# Altium schematic sheet PCB-PWR.SchDoc
size 420 x 297 mm
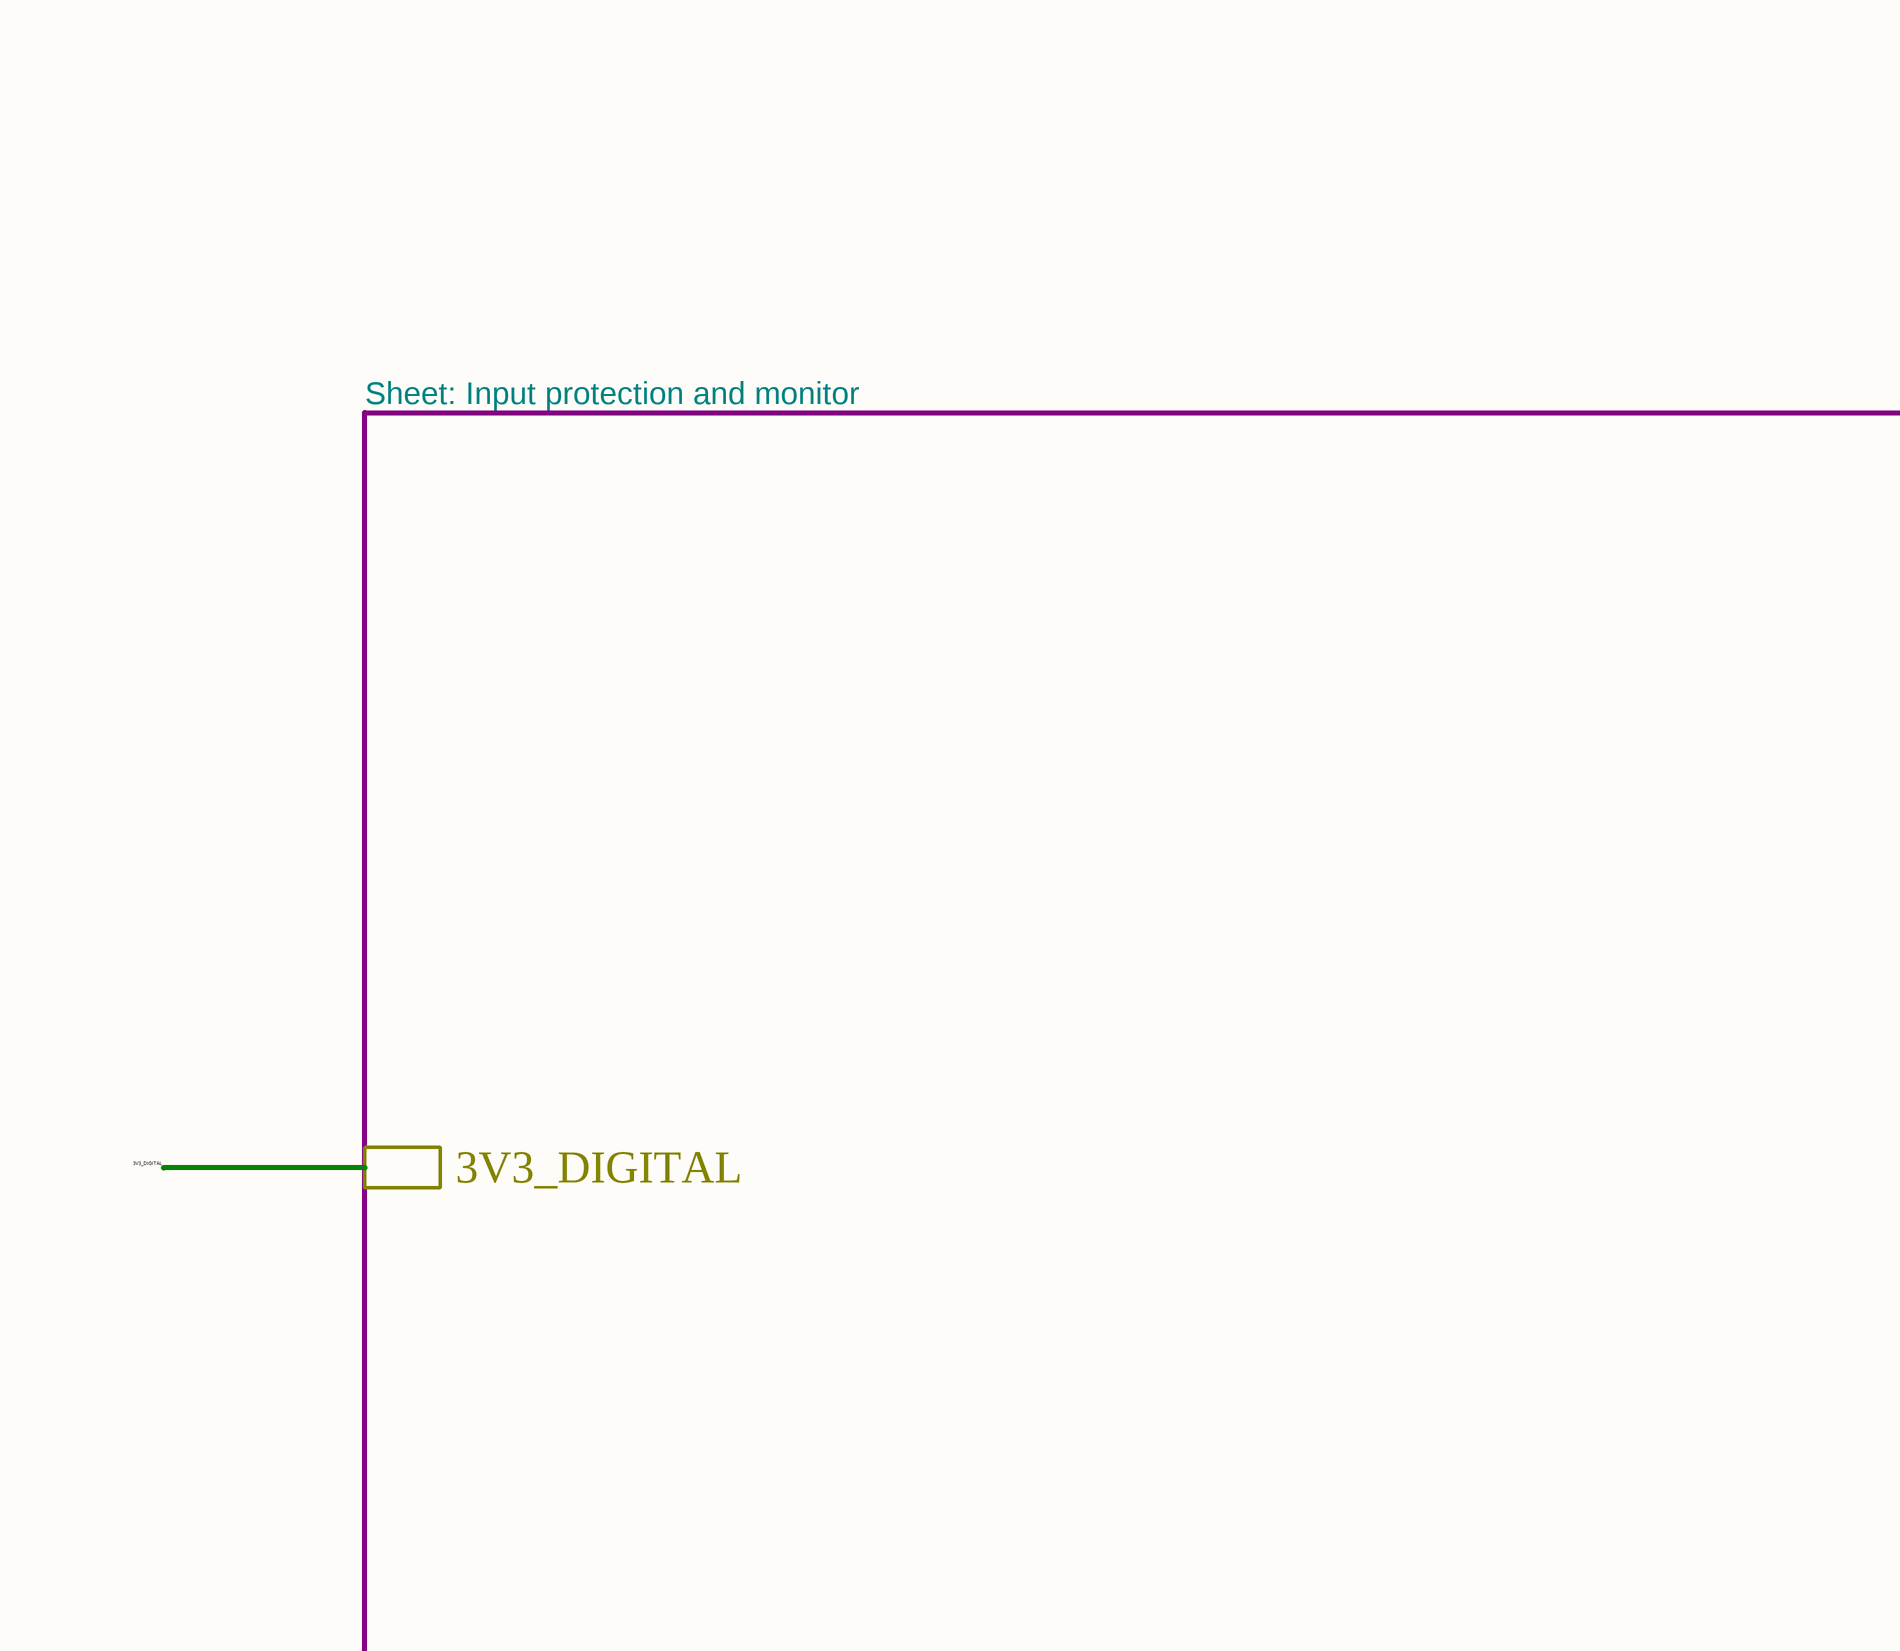
[diagram p0: PCB-PWR.SchDoc, top column 1 of 4]
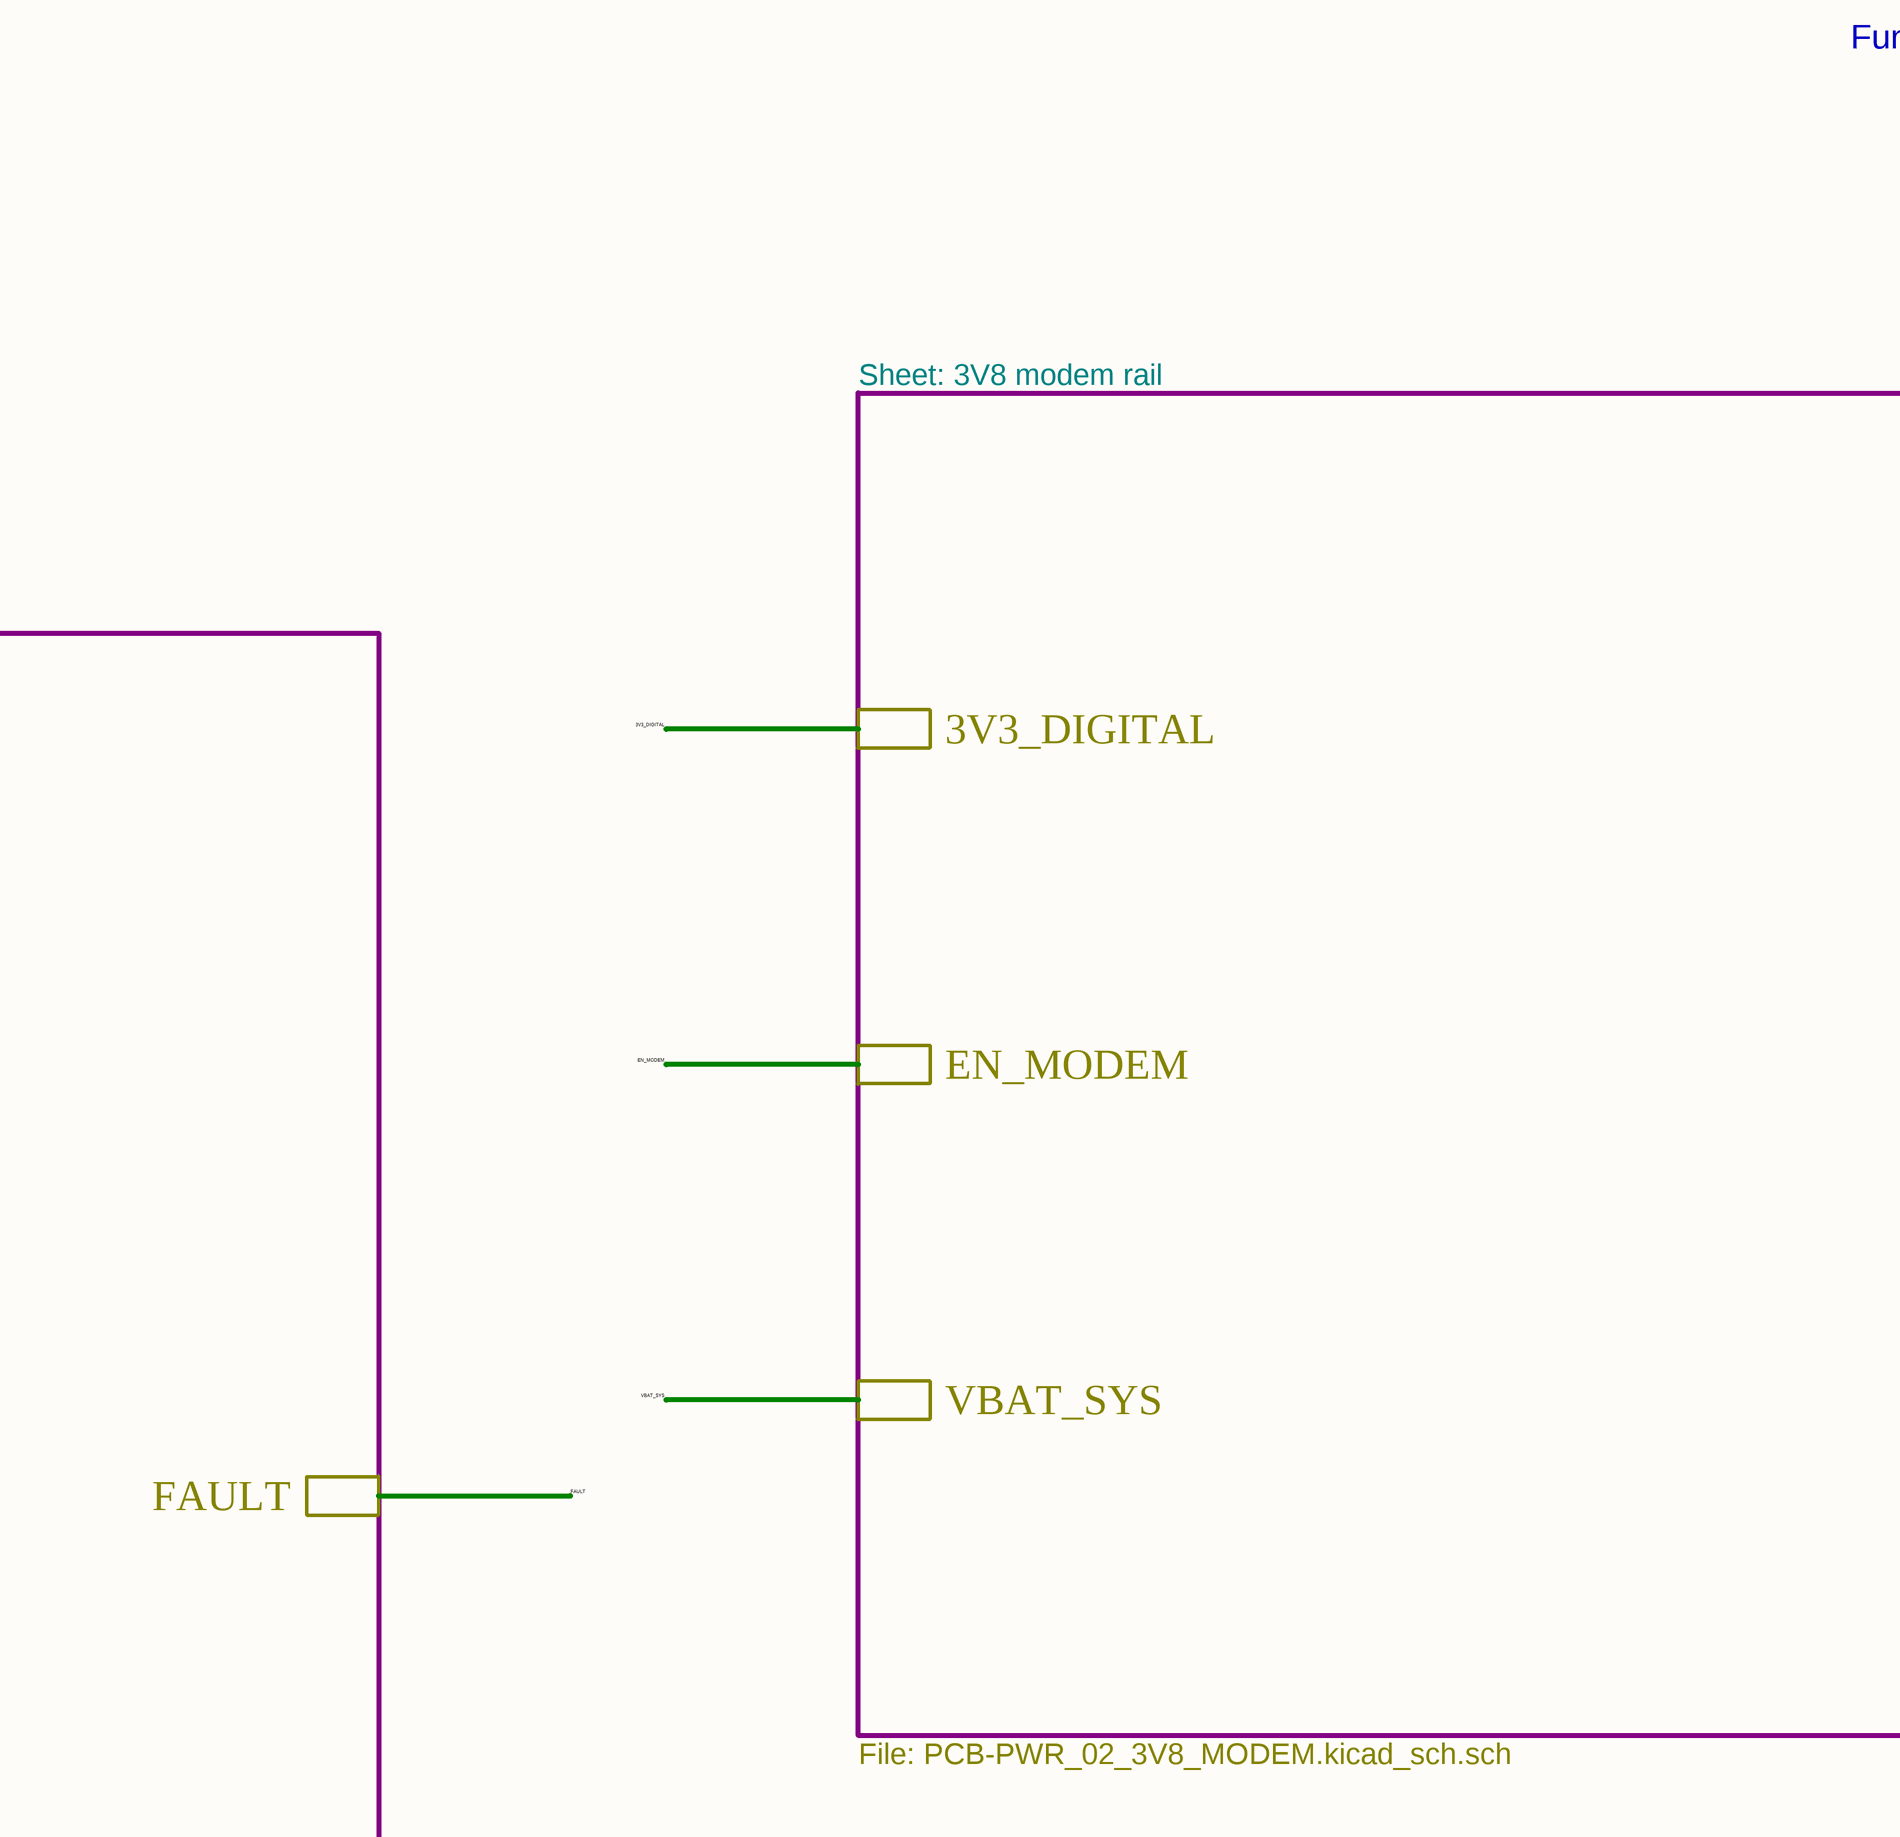
[diagram p1: PCB-PWR.SchDoc, top column 2 of 4]
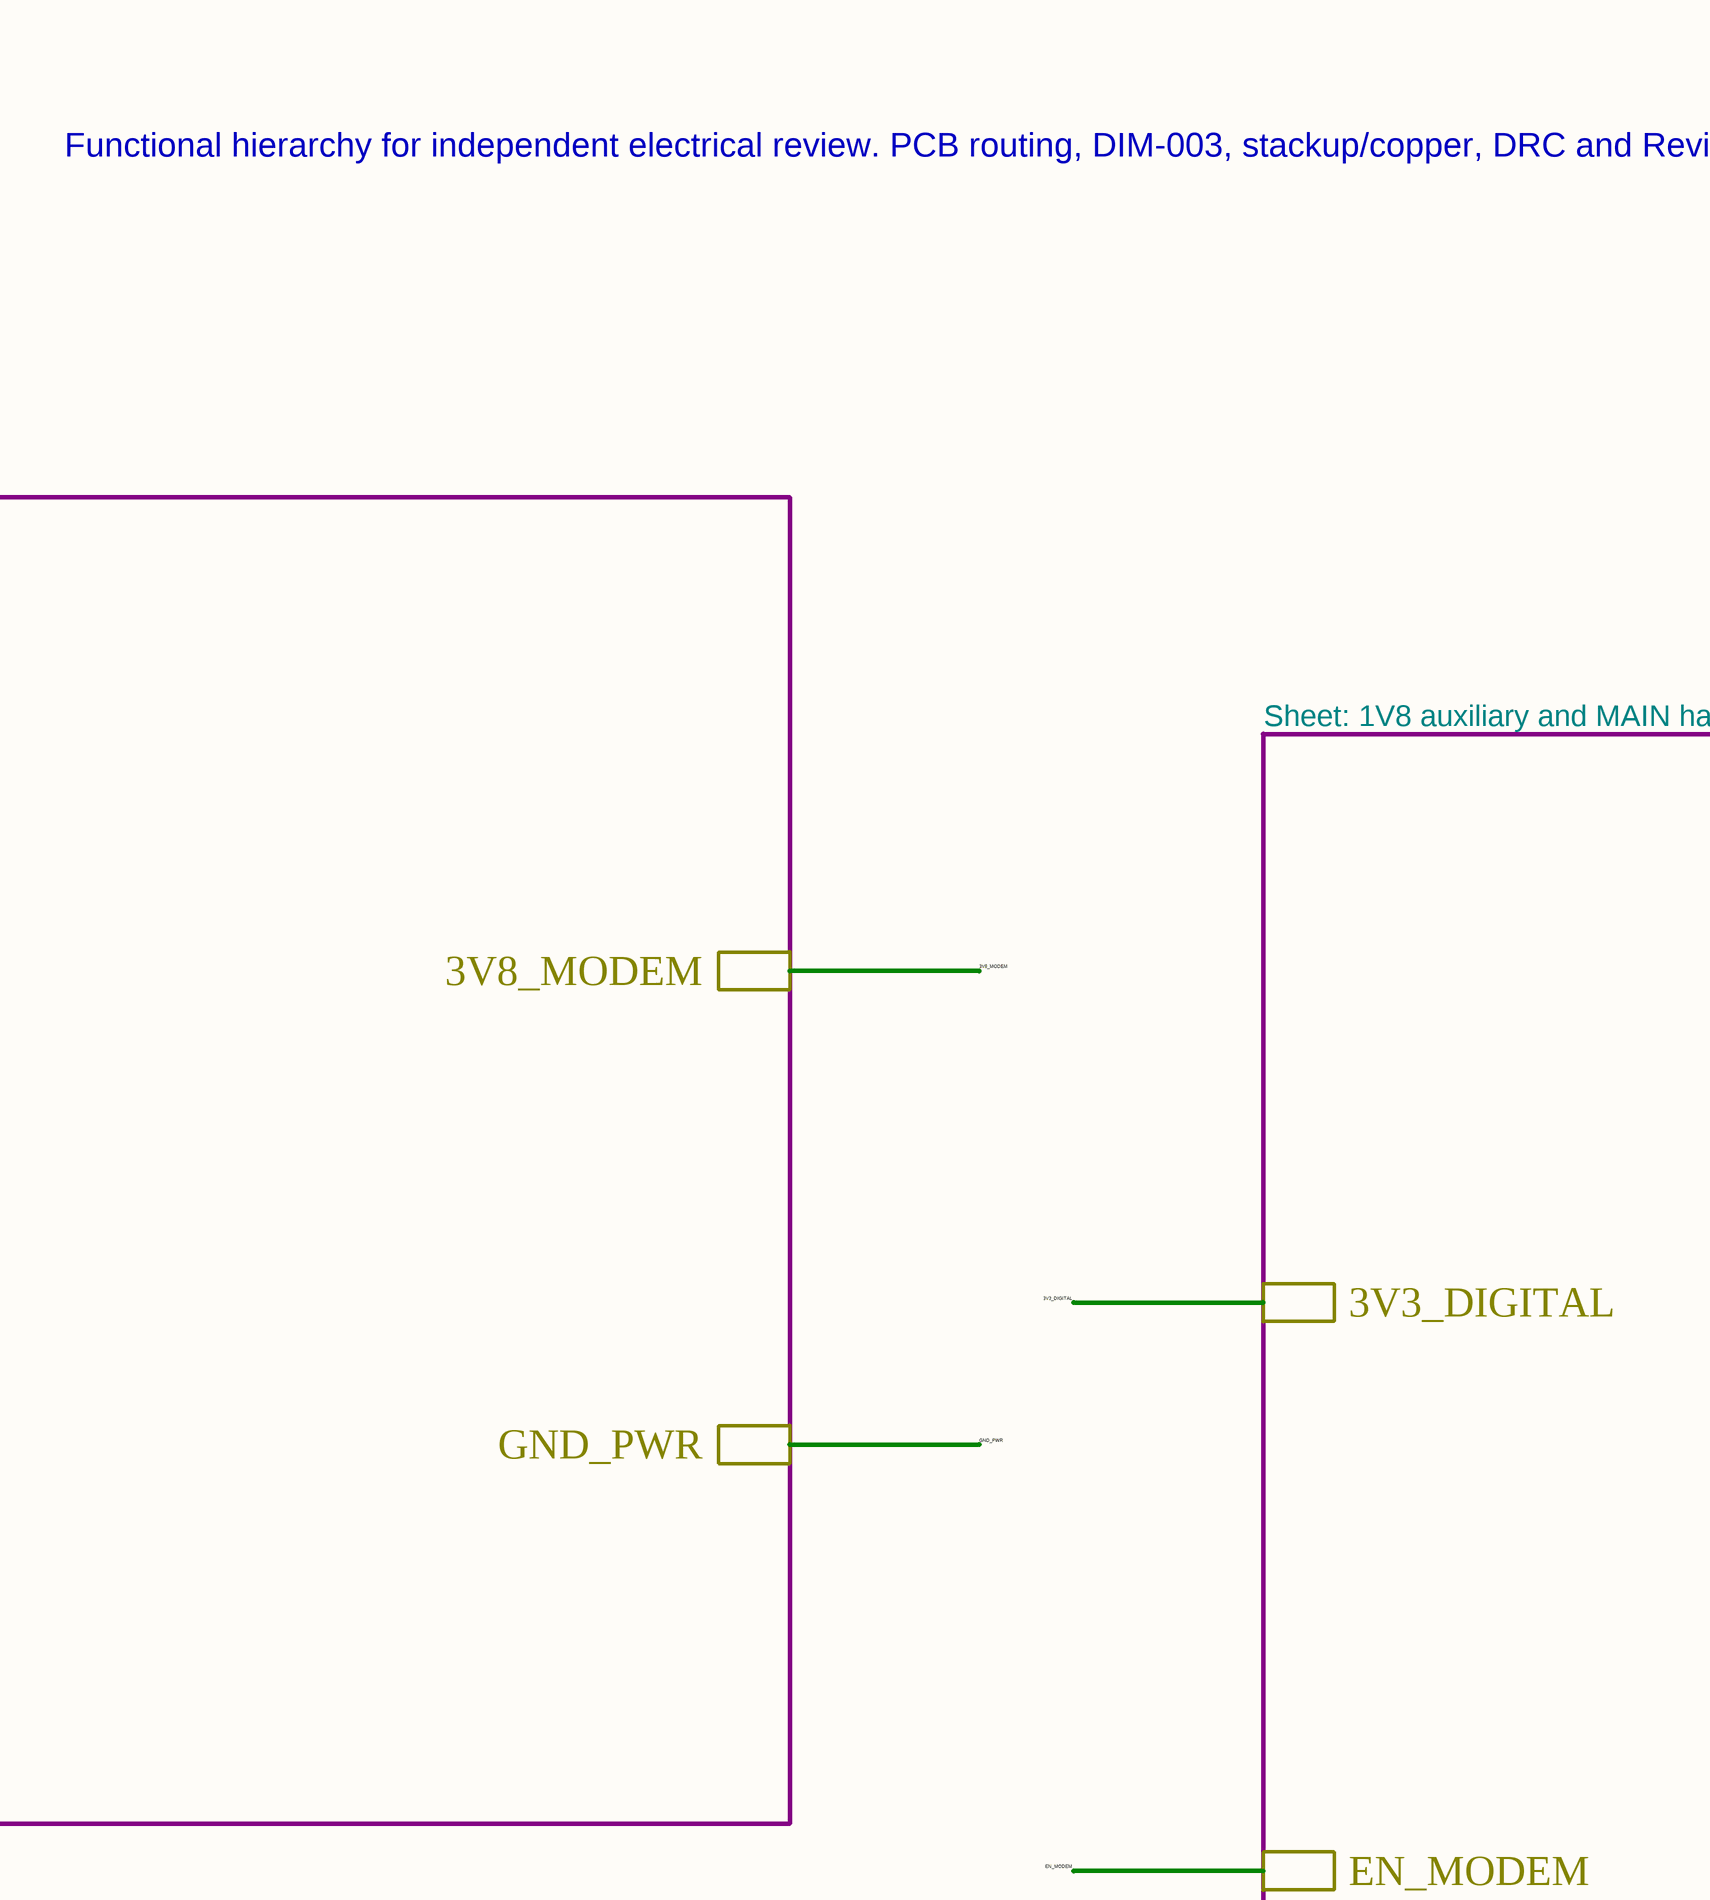
[diagram p2: PCB-PWR.SchDoc, top column 3 of 4]
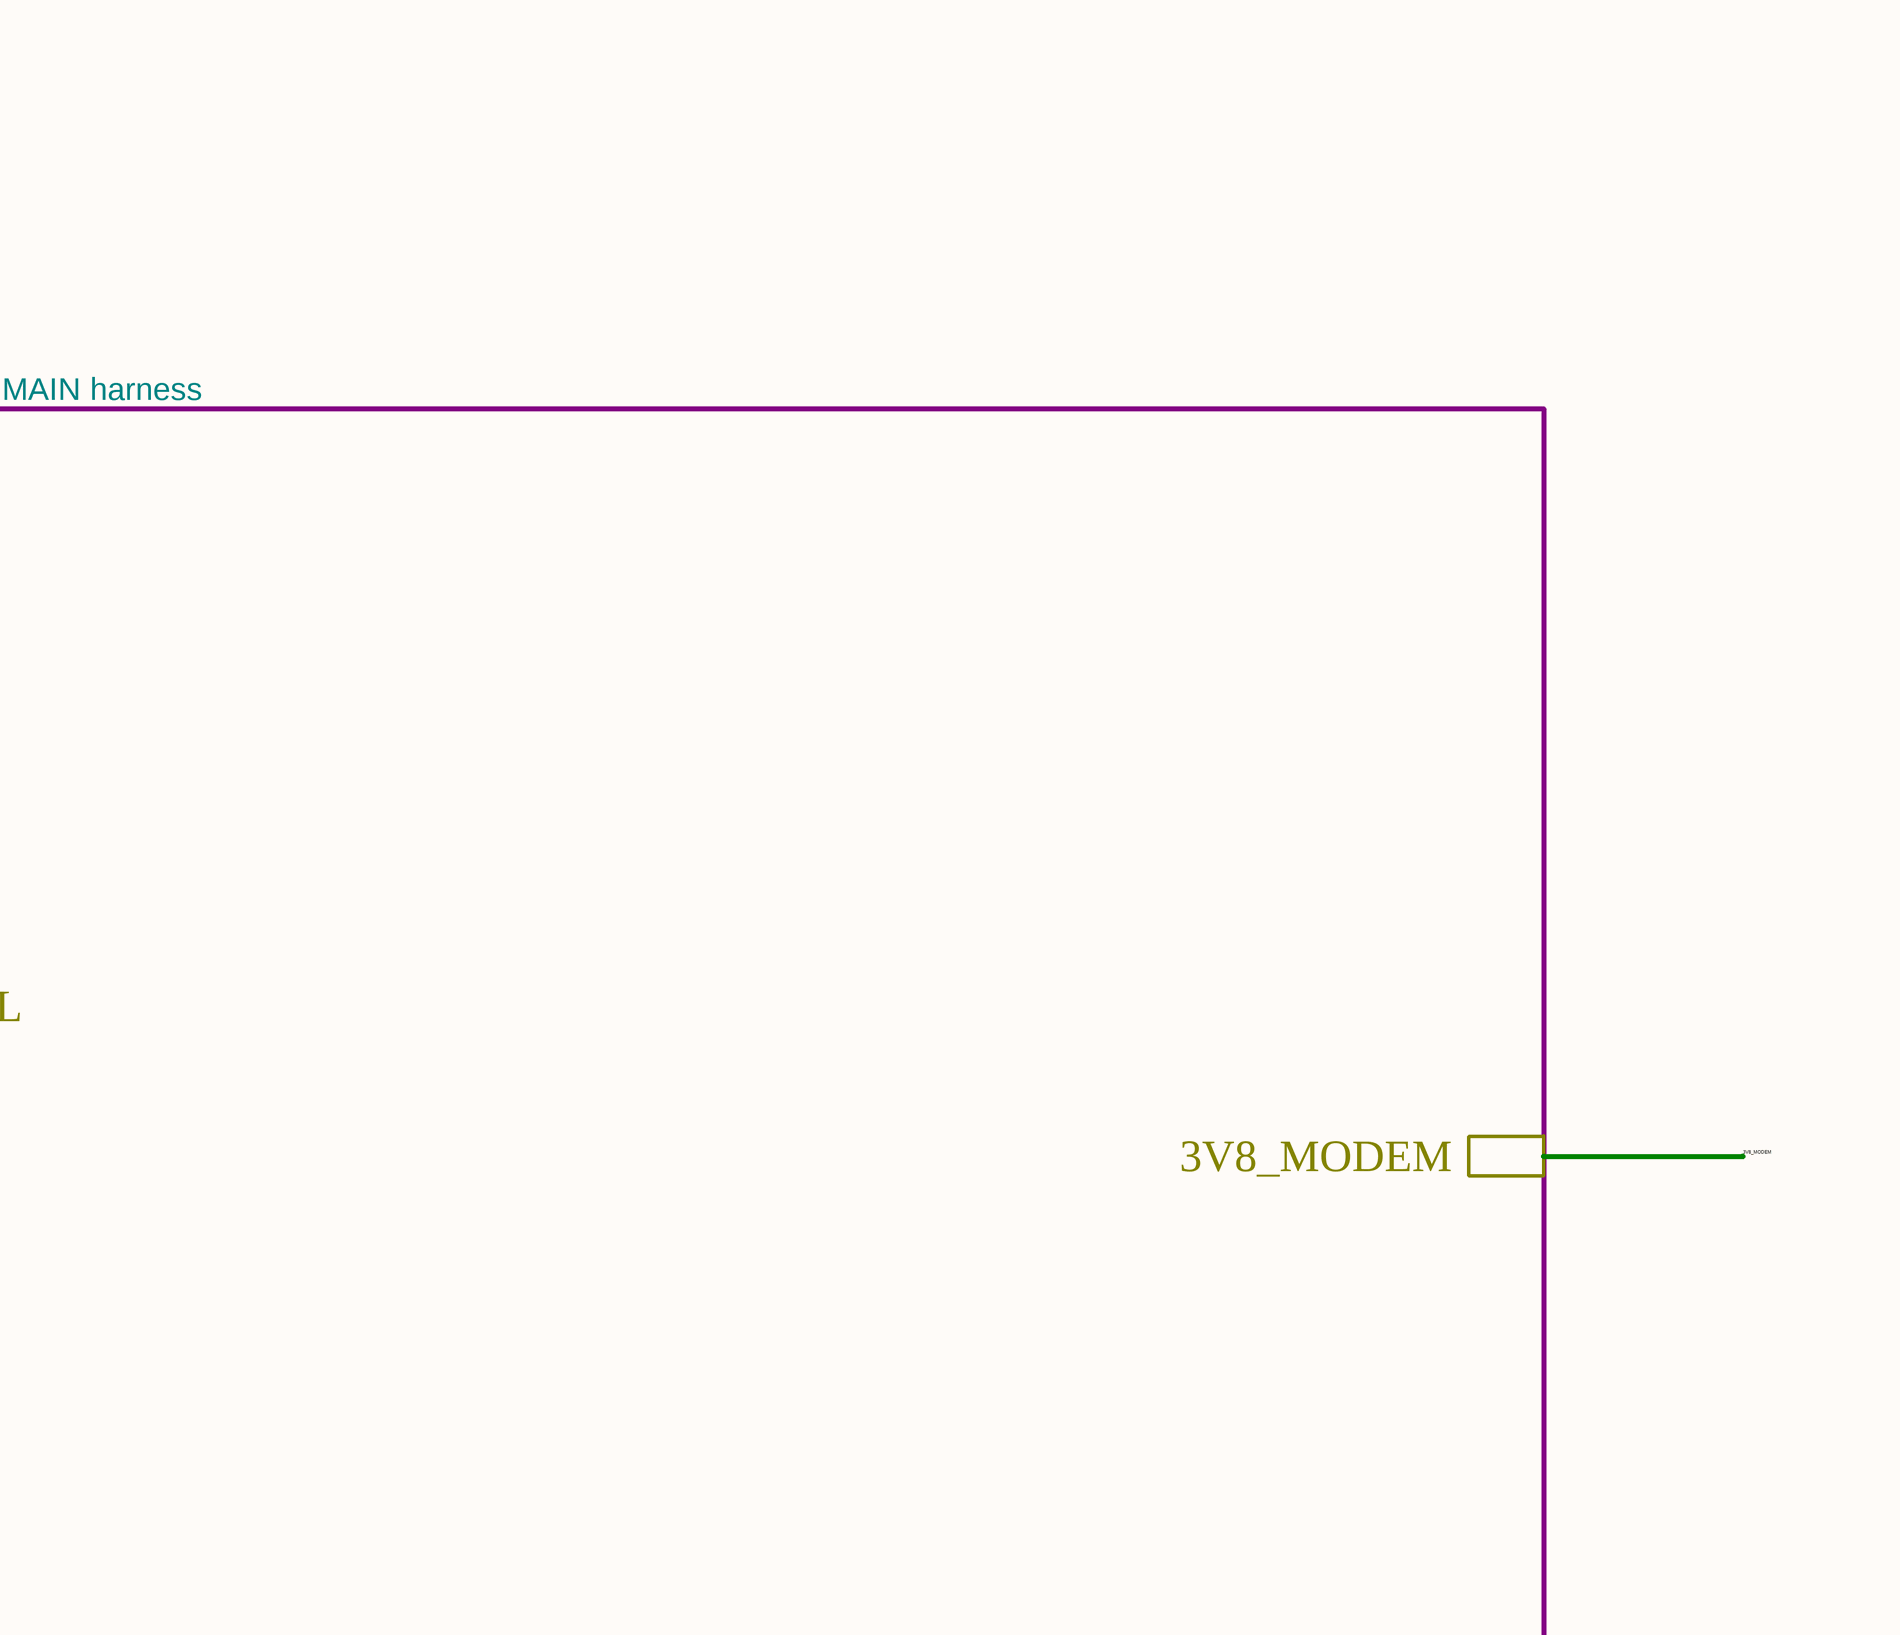
[diagram p3: PCB-PWR.SchDoc, top column 4 of 4]
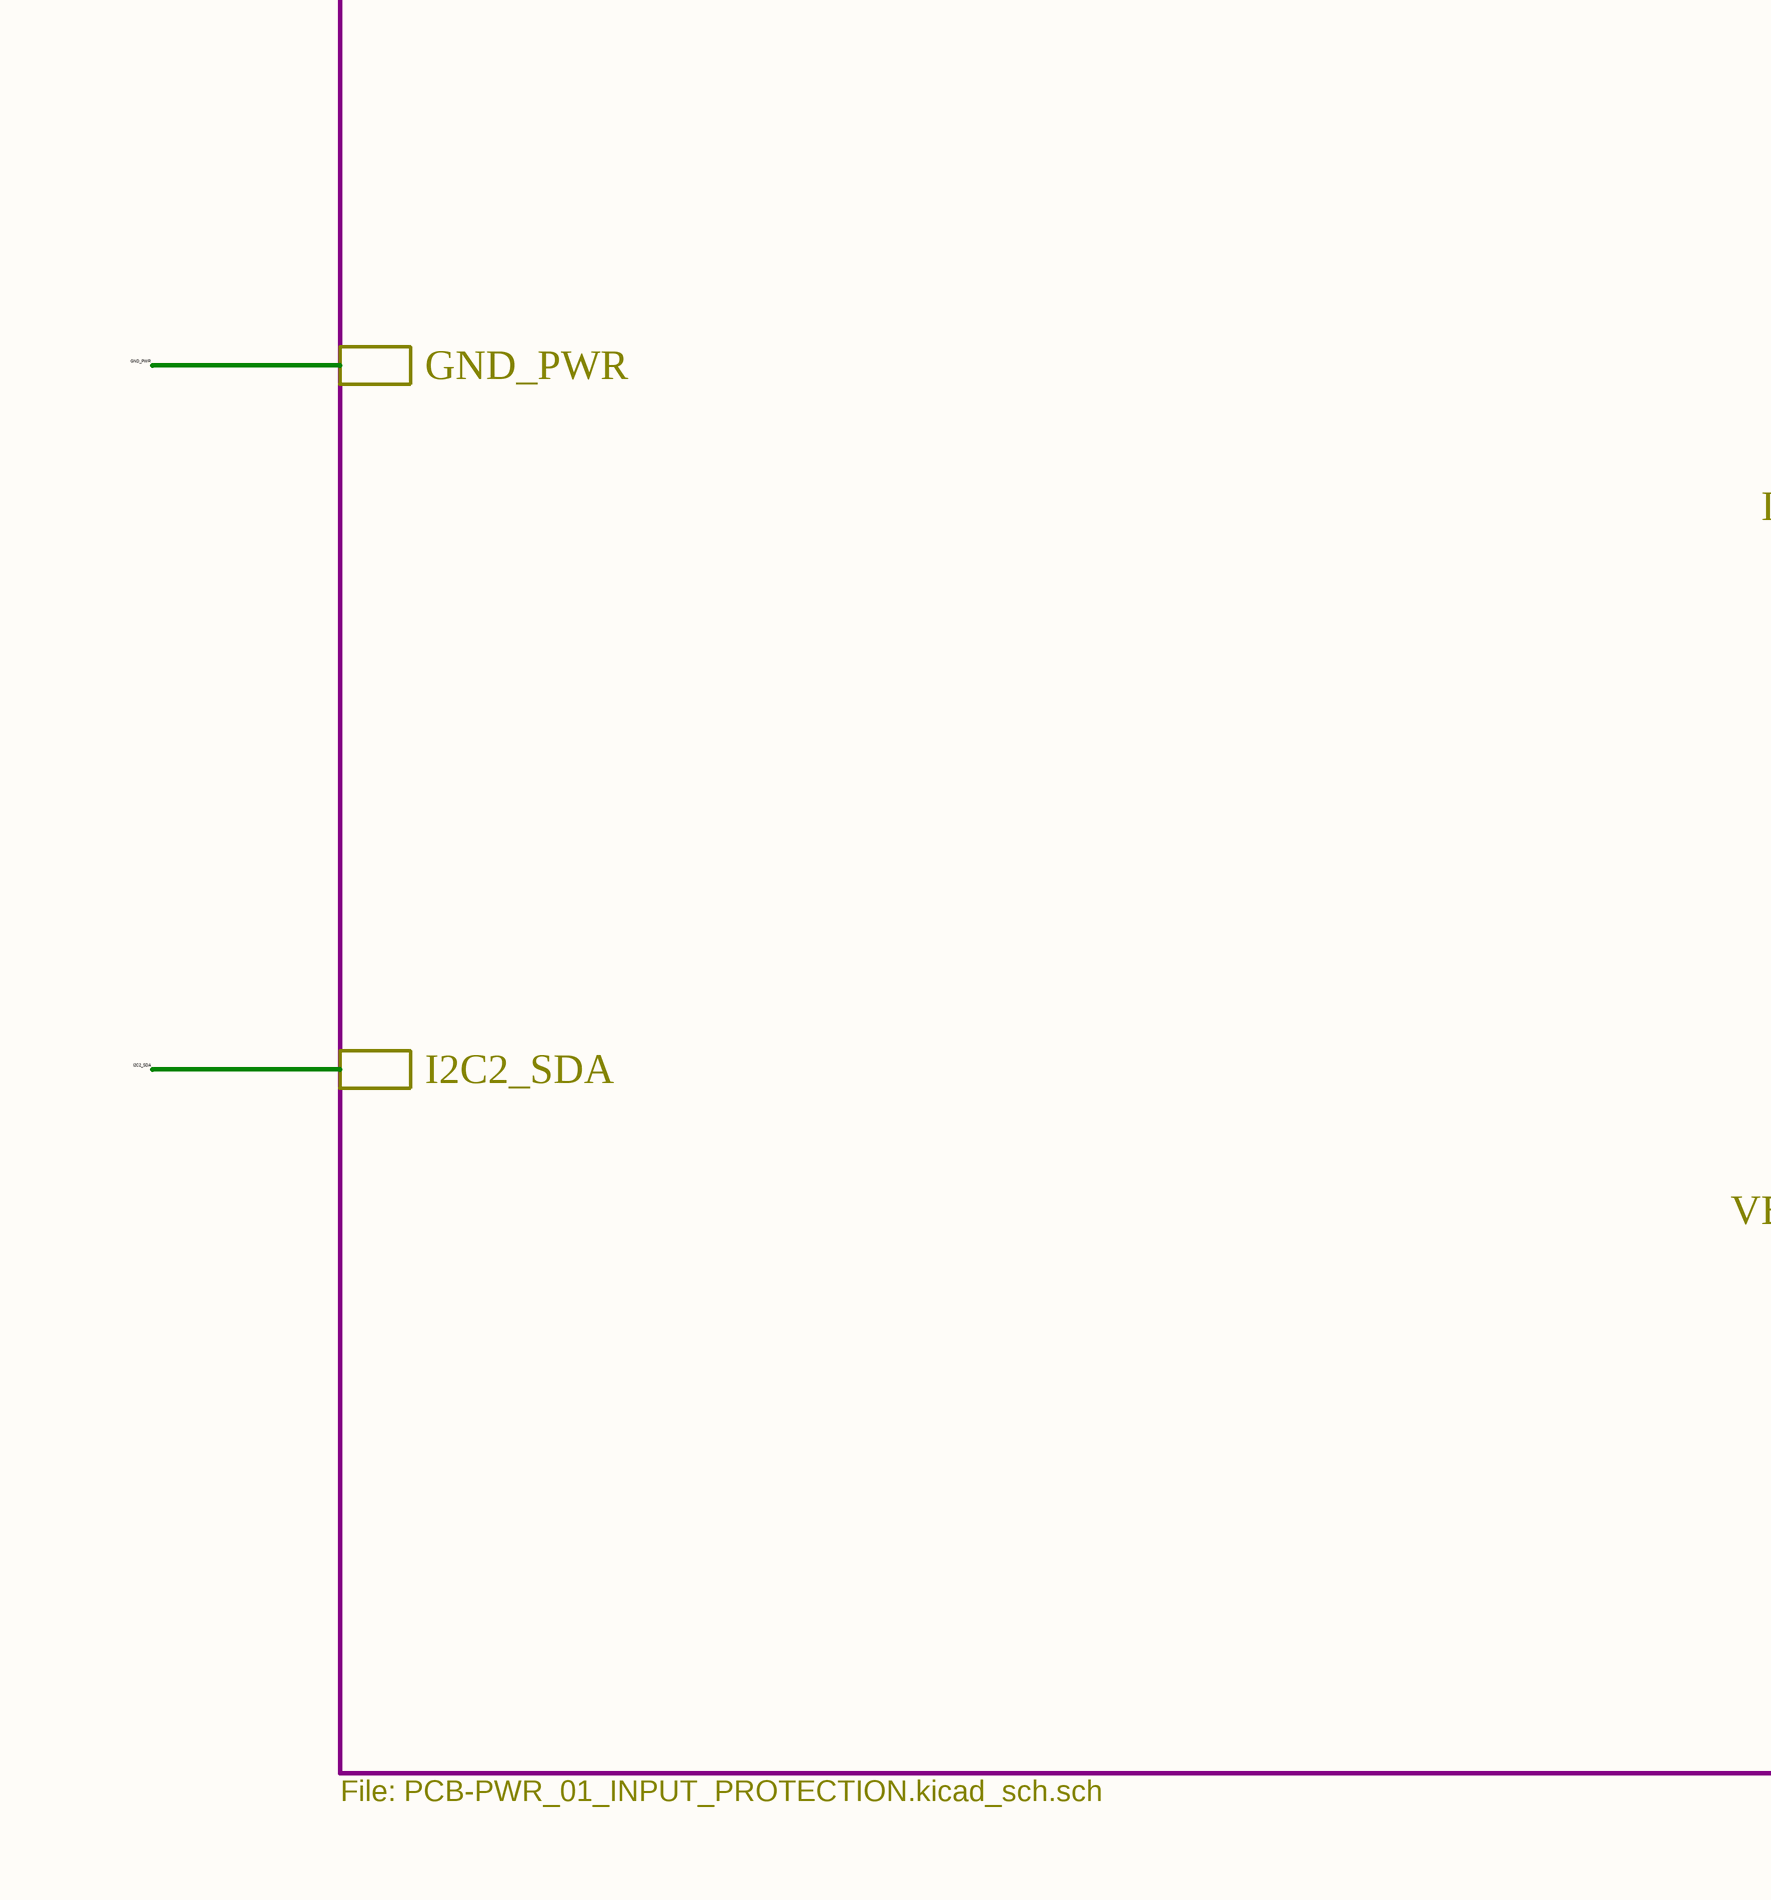
[diagram p4: PCB-PWR.SchDoc, bottom column 1 of 4]
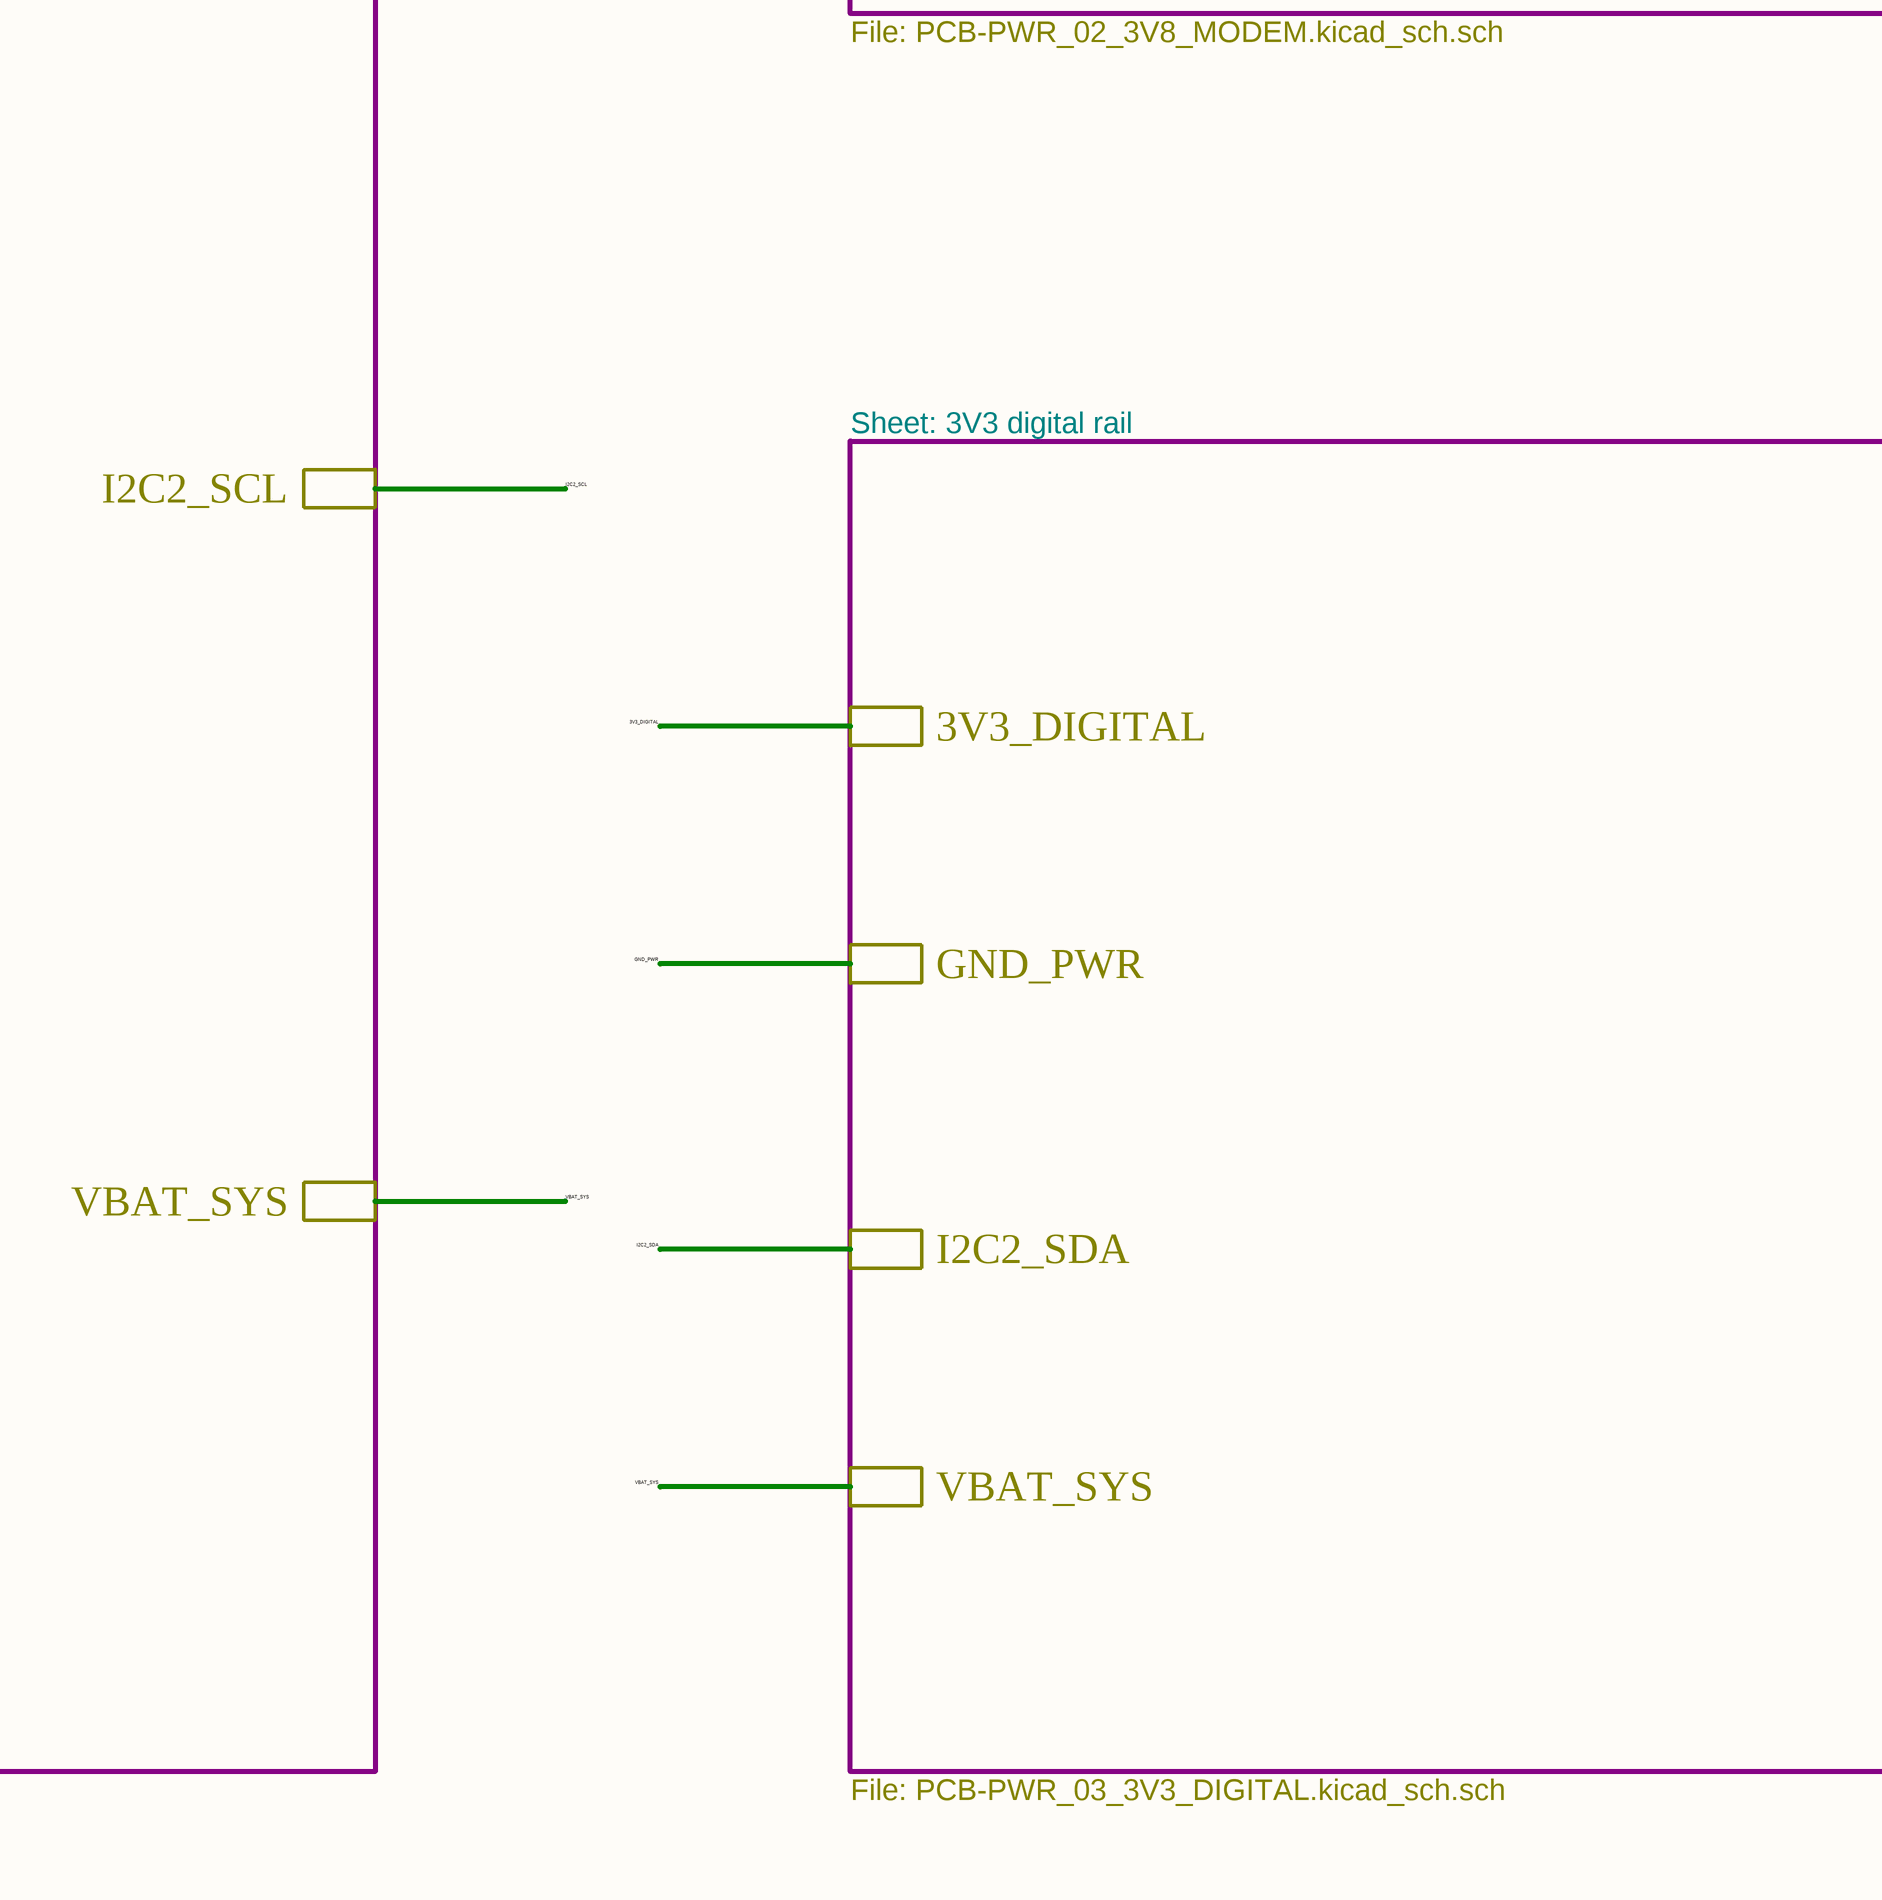
[diagram p5: PCB-PWR.SchDoc, bottom column 2 of 4]
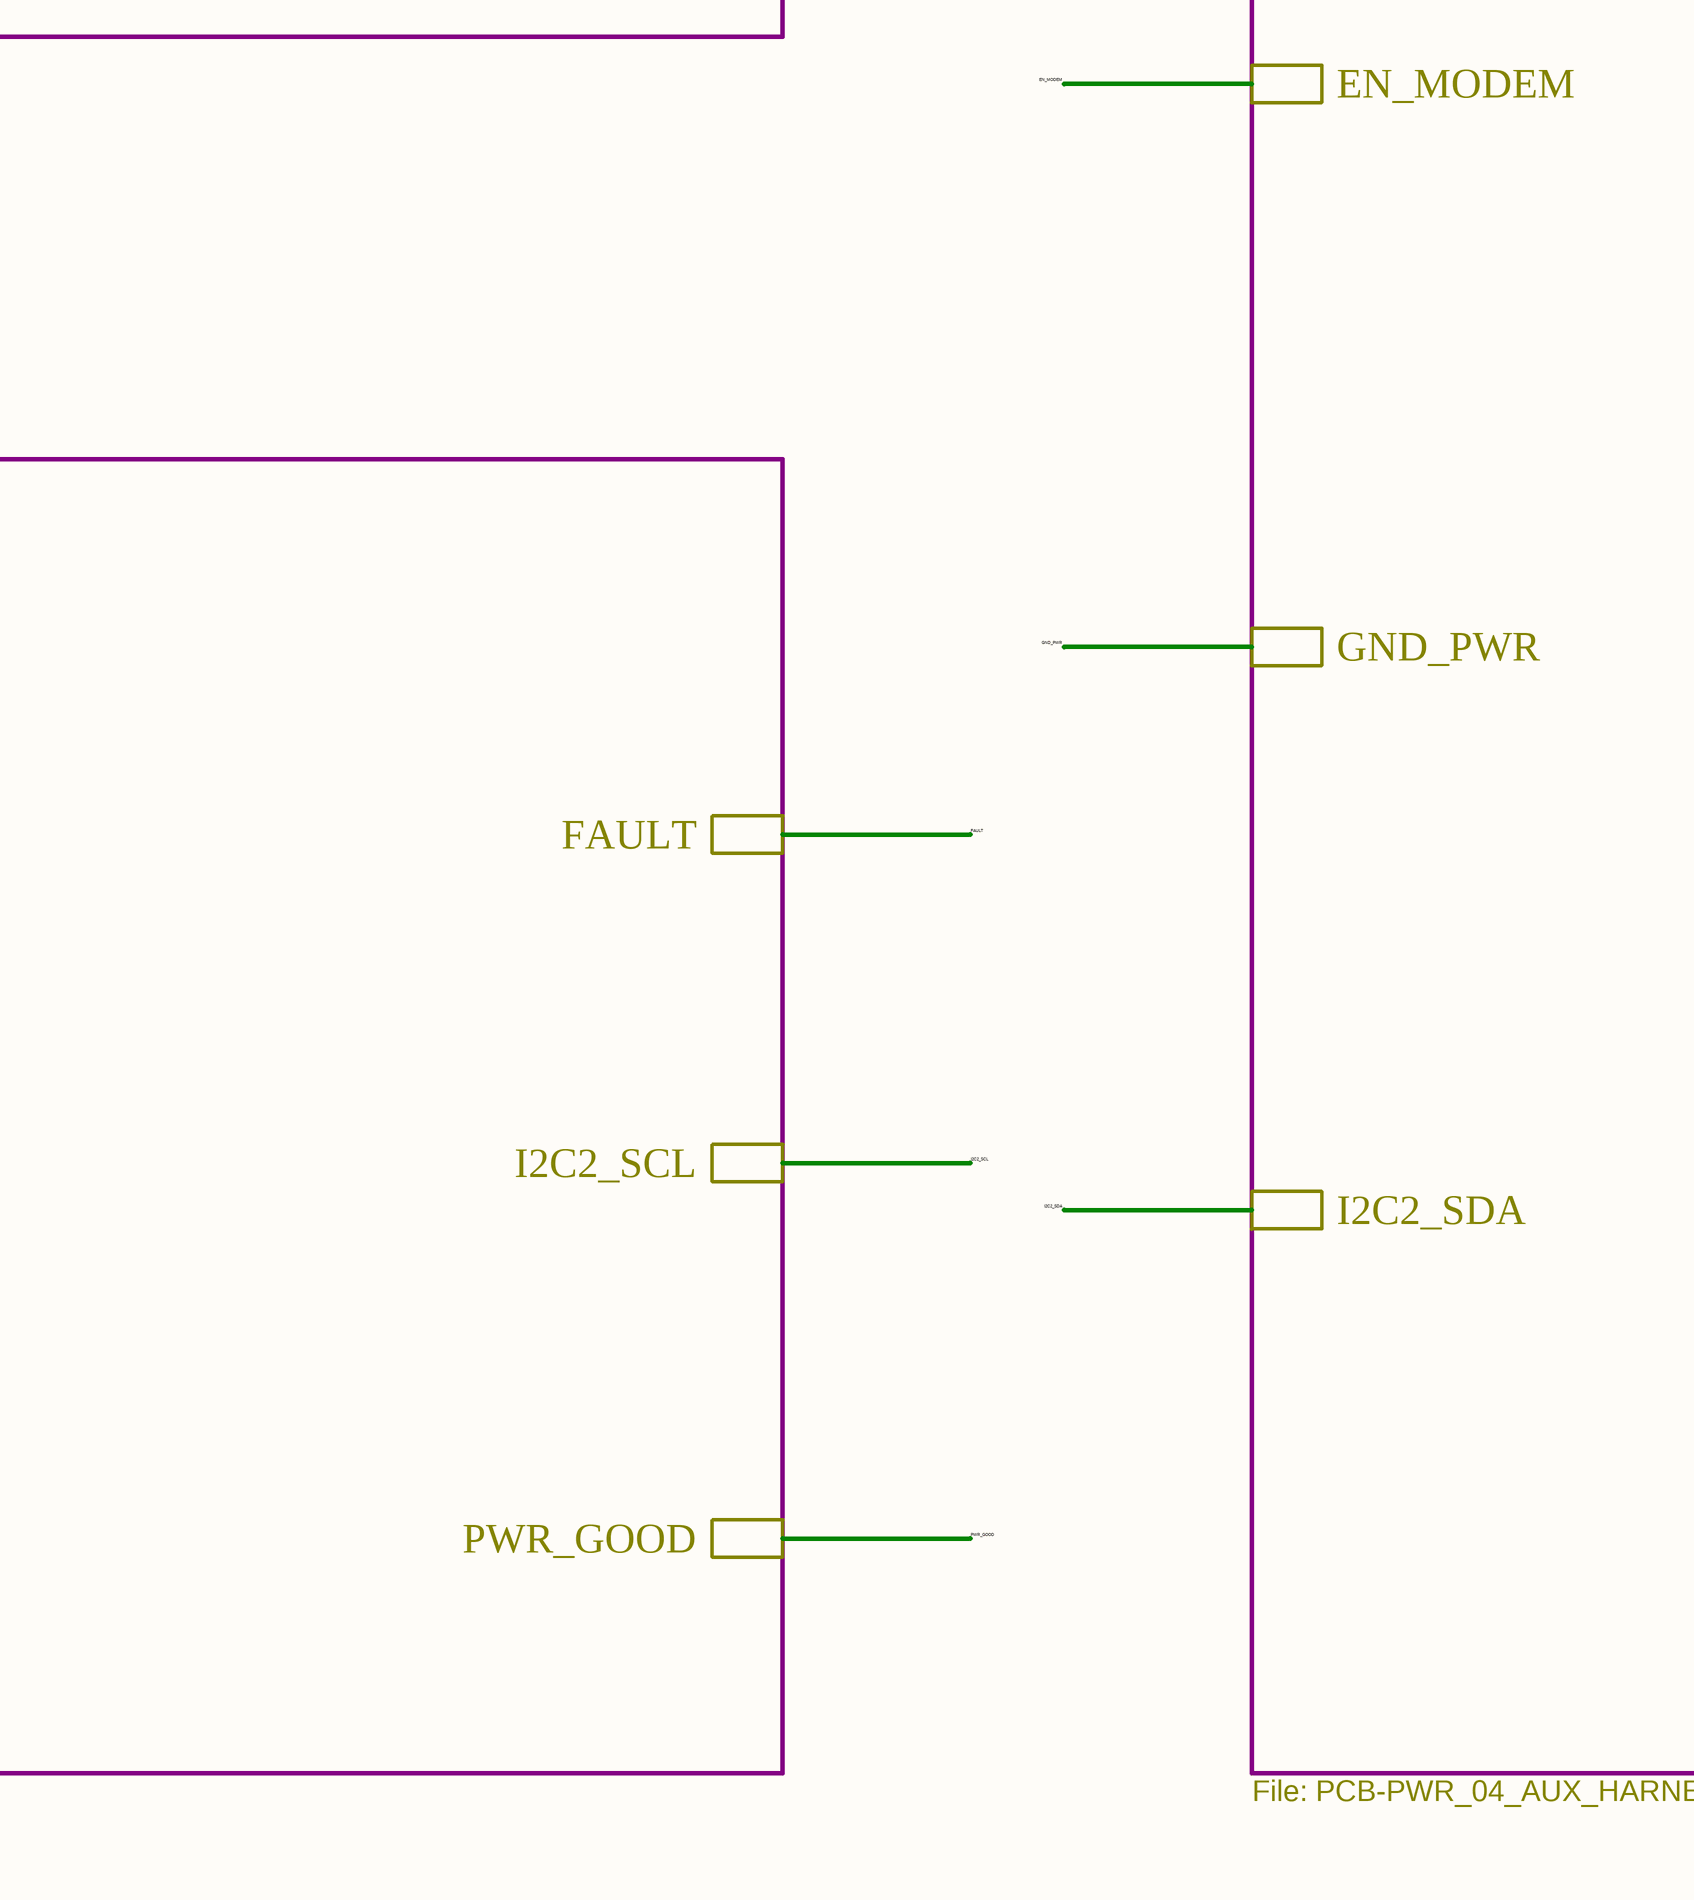
[diagram p6: PCB-PWR.SchDoc, bottom column 3 of 4]
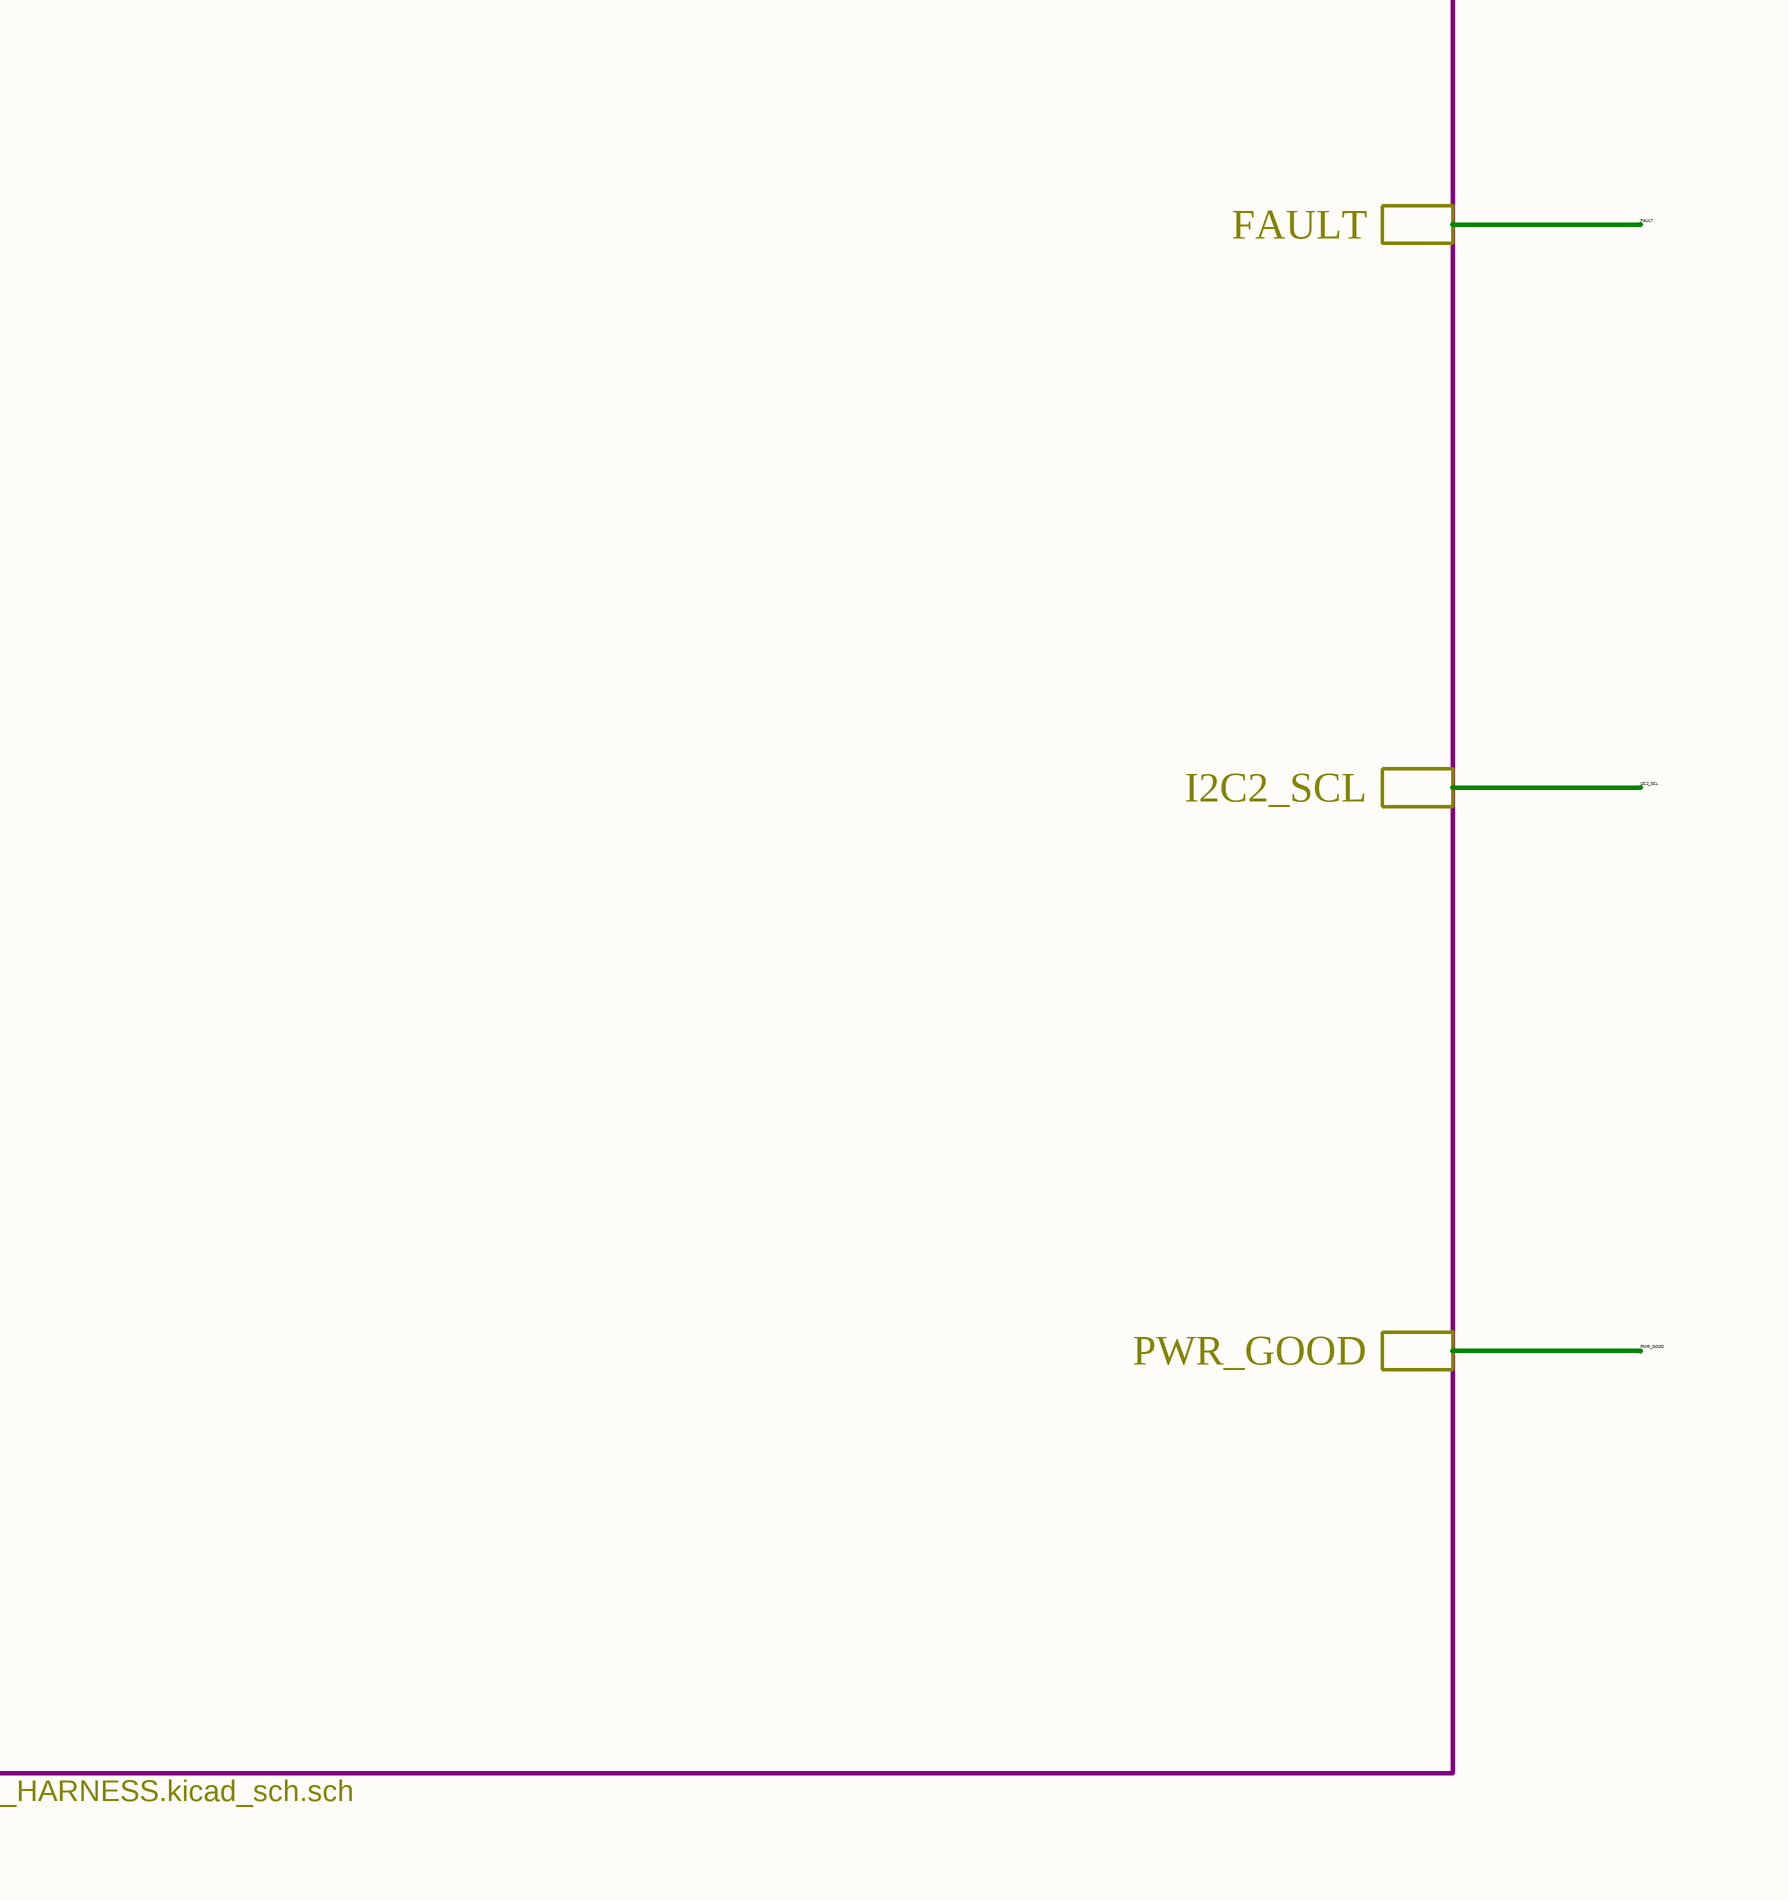
[diagram p7: PCB-PWR.SchDoc, bottom column 4 of 4]

## Sub-sheets
1V8 auxiliary and MAIN harness = PCB-PWR_04_AUX_HARNESS.SchDoc: 3V3_DIGITAL, EN_MODEM, GND_PWR, I2C2_SDA, 3V8_MODEM, FAULT, I2C2_SCL, PWR_GOOD
3V3 digital rail = PCB-PWR_03_3V3_DIGITAL.SchDoc: 3V3_DIGITAL, GND_PWR, I2C2_SDA, VBAT_SYS, FAULT, I2C2_SCL, PWR_GOOD
3V8 modem rail = PCB-PWR_02_3V8_MODEM.SchDoc: 3V3_DIGITAL, EN_MODEM, VBAT_SYS, 3V8_MODEM, GND_PWR
Input protection and monitor = PCB-PWR_01_INPUT_PROTECTION.SchDoc: 3V3_DIGITAL, GND_PWR, I2C2_SDA, FAULT, I2C2_SCL, VBAT_SYS

## Nets
3V3_DIGITAL: sheet Input protection and monitor/3V3_DIGITAL, sheet 3V8 modem rail/3V3_DIGITAL, sheet 3V3 digital rail/3V3_DIGITAL, sheet 1V8 auxiliary and MAIN harness/3V3_DIGITAL
3V8_MODEM: sheet 3V8 modem rail/3V8_MODEM, sheet 1V8 auxiliary and MAIN harness/3V8_MODEM
EN_MODEM: sheet 3V8 modem rail/EN_MODEM, sheet 1V8 auxiliary and MAIN harness/EN_MODEM
FAULT: sheet Input protection and monitor/FAULT, sheet 3V3 digital rail/FAULT, sheet 1V8 auxiliary and MAIN harness/FAULT
GND_PWR: sheet Input protection and monitor/GND_PWR, sheet 3V8 modem rail/GND_PWR, sheet 3V3 digital rail/GND_PWR, sheet 1V8 auxiliary and MAIN harness/GND_PWR
I2C2_SCL: sheet Input protection and monitor/I2C2_SCL, sheet 3V3 digital rail/I2C2_SCL, sheet 1V8 auxiliary and MAIN harness/I2C2_SCL
I2C2_SDA: sheet Input protection and monitor/I2C2_SDA, sheet 3V3 digital rail/I2C2_SDA, sheet 1V8 auxiliary and MAIN harness/I2C2_SDA
PWR_GOOD: sheet 3V3 digital rail/PWR_GOOD, sheet 1V8 auxiliary and MAIN harness/PWR_GOOD
VBAT_SYS: sheet Input protection and monitor/VBAT_SYS, sheet 3V8 modem rail/VBAT_SYS, sheet 3V3 digital rail/VBAT_SYS

## Notes on the sheet
- Functional hierarchy for independent electrical review. PCB routing, DIM-003, stackup/copper, DRC and Review B remain open.
- Sheet: 3V8 modem rail
- Sheet: Input protection and monitor
- Sheet: 1V8 auxiliary and MAIN harness
- File: PCB-PWR_02_3V8_MODEM.kicad_sch.sch
- Sheet: 3V3 digital rail
- File: PCB-PWR_01_INPUT_PROTECTION.kicad_sch.sch
- File: PCB-PWR_03_3V3_DIGITAL.kicad_sch.sch
- File: PCB-PWR_04_AUX_HARNESS.kicad_sch.sch
- 1
- 2
- 3
- 4
- 5
- 6
- 7
- 8
- A
- B
- C
- D
- E
- Human-readable hierarchy; exact pin/net equivalence enforced
- Root sheet 1 of 5
- NOT FOR MANUFACTURE - routing/DRC/DFM/Review B pending
- Title: PCB-PWR system overview
- File: PCB-PWR.kicad_sch
- Sheet: /
- Dioneya / ZS-BPLA
- F
- KiCad E.D.A.  kicad (5.1.4)-1
- Size: A3
- Date: 2026-09-17
- Rev: A
- Id: 1/1